# Altium schematic sheet PIC.SchDoc
size A4; SheetNumber: 1; SheetTotal: 1
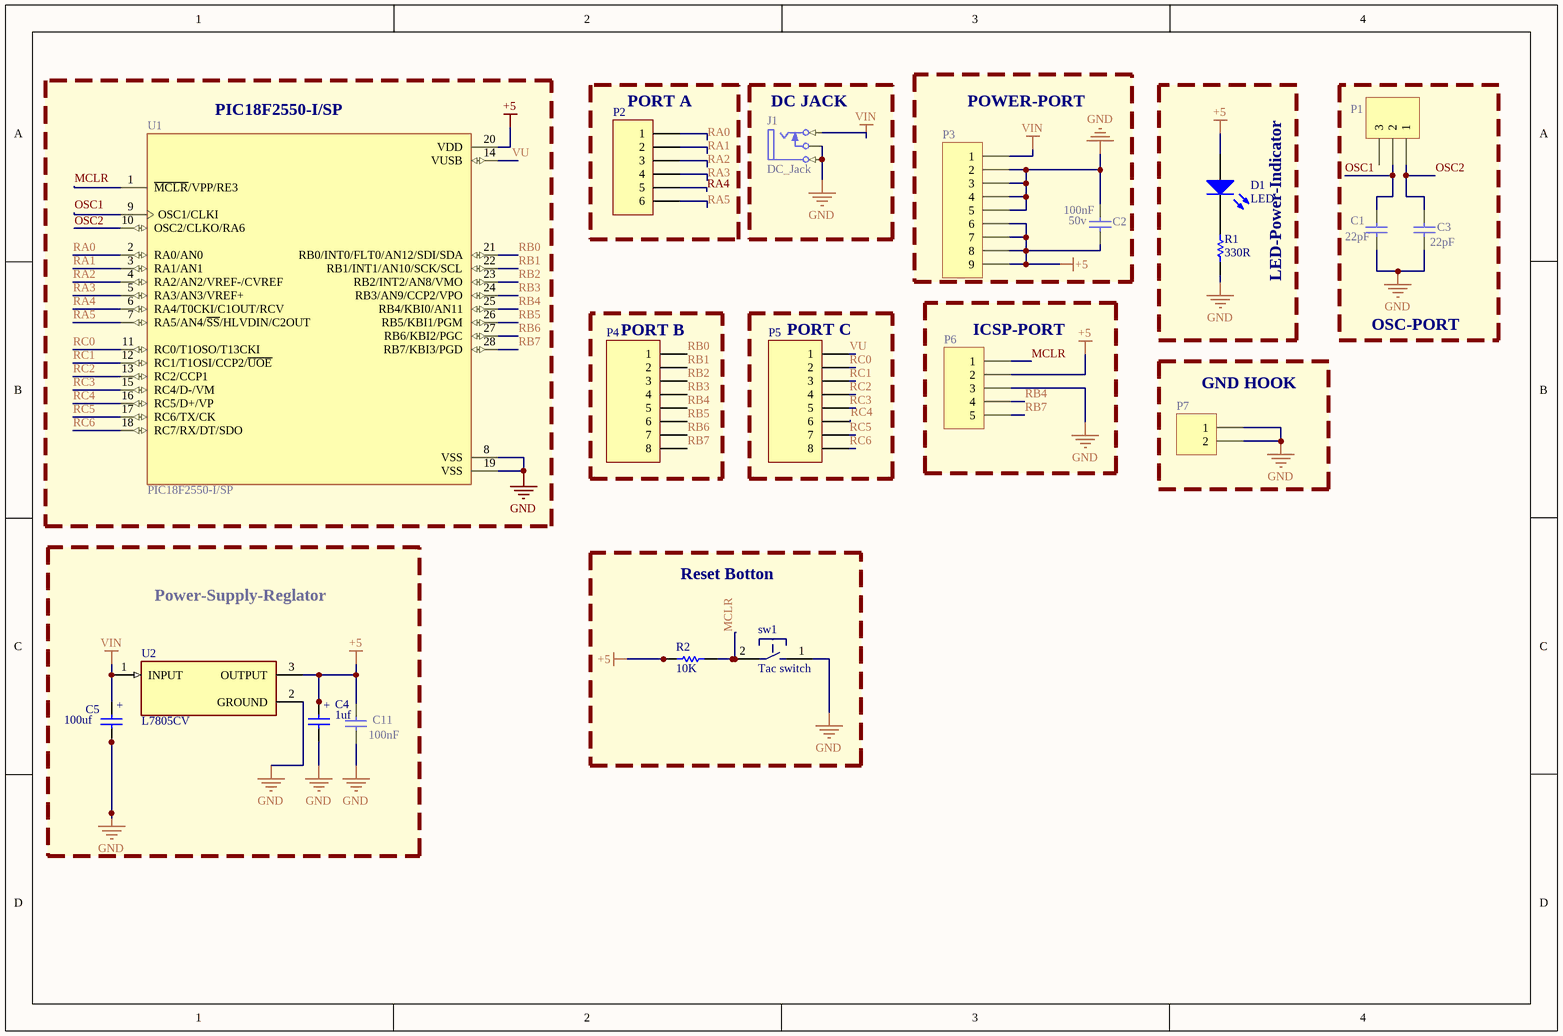
[diagram p0: PIC.SchDoc]

## Parts
C1  22pF  [My_cap100n]
C2  Volte: 50v  [My_cap100n]  (hidden comment: 100nF)
C3  22pF  [My_cap100n]
C4  1uf  [MY_E2.5-5mm]
C5  100uf  [MY_E2.5-5mm]
C11  100nF  [My_cap100n]
D1  LED  [My_LED3MM]
J1  DC_Jack  [My_DC_Jack]
P1  Header 3  [MY_FE03]  (value not drawn)
P2  Header 6  [MY_FE06]  (value not drawn)
P3  Header 9  [MY_FE09]  (value not drawn)
P4  Header 8  [MY_FE08]  (value not drawn)
P5  Header 8  [MY_FE08]  (value not drawn)
P6  Header 5  [MY_FE05]  (value not drawn)
P7  Header 2  [My_1X02]  (value not drawn)
R1  330R  [MY_(0.25w)_0207_10]
R2  10K  [MY_(0.25w)_0207_10]
sw1  Tac switch  [MY_TACTILE-PTH]
U1  PIC18F2550-I/SP  [DIP787W45P254L3556H508Q28]
U2  L7805CV  [TO255P1040X460X1968-3]

## Blocks framed on the sheet
PIC18F2550-I/SP: U1
PORT A: P2
DC JACK: J1
POWER-PORT: C2 P3
LED-Power-Indicator: D1 R1
OSC-PORT: C1 C3 P1
PORT B: P4
PORT C: P5
ICSP-PORT: P6
GND HOOK: P7
Power-Supply-Reglator: C4 C5 C11 U2
Reset Botton: R2 sw1

## Nets
+5: C2.1 C4.+ C11.2 D1.A P3.6 P3.7 P3.8 P3.9 P6.2 R2.1 U1.20(VDD) U2.3(OUTPUT)
GND: C1.1 C2.2 C3.1 C4.- C5.- C11.1 J1.2(TN) J1.3(S) P3.2 P3.3 P3.4 P3.5 P6.3 P7.1 P7.2 R1.1 sw1.1 U1.8(VSS) U1.19(VSS) U2.2(GROUND)
VIN: C5.+ J1.1(T) P3.1 U2.1(INPUT)
MCLR: P6.1 R2.2 sw1.2 U1.1(~{MCLR}/VPP/RE3)
OSC1: C1.2 P1.2 U1.9(OSC1/CLKI)
OSC2: C3.2 P1.1 U1.10(OSC2/CLKO/RA6)
RA0: P2.1 U1.2(RA0/AN0)
RA1: P2.2 U1.3(RA1/AN1)
RA2: P2.3 U1.4(RA2/AN2/VREF-/CVREF)
RA3: P2.4 U1.5(RA3/AN3/VREF+)
RA4: P2.5 U1.6(RA4/T0CKI/C1OUT/RCV)
RA5: P2.6 U1.7(RA5/AN4/~{SS}/HLVDIN/C2OUT)
RB0: P4.1 U1.21(RB0/INT0/FLT0/AN12/SDI/SDA)
RB1: P4.2 U1.22(RB1/INT1/AN10/SCK/SCL)
RB2: P4.3 U1.23(RB2/INT2/AN8/VMO)
RB3: P4.4 U1.24(RB3/AN9/CCP2/VPO)
RB4: P4.5 P6.4 U1.25(RB4/KBI0/AN11)
RB5: P4.6 U1.26(RB5/KBI1/PGM)
RB6: P4.7 U1.27(RB6/KBI2/PGC)
RB7: P4.8 P6.5 U1.28(RB7/KBI3/PGD)
RC0: P5.2 U1.11(RC0/T1OSO/T13CKI)
RC1: P5.3 U1.12(RC1/T1OSI/CCP2/~{UOE})
RC2: P5.4 U1.13(RC2/CCP1)
RC3: P5.5 U1.15(RC4/D-/VM)
RC4: P5.6 U1.16(RC5/D+/VP)
RC5: P5.7 U1.17(RC6/TX/CK)
RC6: P5.8 U1.18(RC7/RX/DT/SDO)
VU: P5.1 U1.14(VUSB)
NetD1_K: D1.K R1.2

Not connected (* = marked no-connect by the designer): P1 3

## Library data of the parts
C1 C3 C11 = Cap ceramic: None polar capacitor; ASiD Part Number: C-AS; Volte: 50v
  C1 C3: Value: 22pF
  C11: Value: 100nF
C2 = Cap ceramic: None polar capacitor; ASiD Part Number: C-AS; Value: 100nF
C4 C5 = Cap Pol: Polar capacitor; ASiD Part Number: C-AS; Volte: 25v
  C4: Value: 1uf
  C5: Value: 100uf
D1 = LED: Typical INFRARED GaAs LED; ASiD Part Number: LED-AS
J1 = DC_Jack: ASiD Part Number: DC_Jack-AS
P1 = Header 3: Header, 3-Pin; ASiD Part Number: Header 3-AS
P2 = Header 6: Header, 6-Pin; ASiD Part Number: Header 6-AS
P3 = Header 9: Header, 9-Pin; ASiD Part Number: Header 9-AS
P4 P5 = Header 8: Header, 8-Pin, Dual row; ASiD Part Number: Header 8-AS
P6 = Header 5: Header, 5-Pin; ASiD Part Number: Header 5-AS
P7 = Header 2: Header, 2-Pin; ASiD Part Number: Header 2-AS
R1 R2 = Res: Standard resistor 1K; ASiD Part Number: Res-AS
  R1: Value: 330R
  R2: Value: 10K
sw1 = Tac switch: small tac switch; ASiD Part Number: Tac switch-AS
U1 = PIC18F2550-I/SP: PIC PICÂ® 18F Microcontroller IC 8-Bit 48MHz 32KB (16K x 16) FLASH 28-SPDIP; MF: Microchip; Digi-Key_Part_Number: PIC18F2550-I/SP-ND; SnapEDA_Link: https://www.snapeda.com/parts/PIC18F2550-I/SP/Microchip/view-part/?ref=snap; Check_prices: https://www.snapeda.com/parts/PIC18F2550-I/SP/Microchip/view-part/?ref=eda; MP: PIC18F2550-I/SP; Package: SPDIP-28 Microchip; Purchase-URL: https://pricing.snapeda.com/search/part/PIC18F2550-I/SP/?ref=eda; Value: *
U2 = L7805CV: Linear Voltage Regulator IC Positive Fixed 1 Output 1.5A TO-220; MF: STMicroelectronics; SnapEDA_Link: https://www.snapeda.com/parts/L7805CV/STMicroelectronics/view-part/?ref=snap; Package: TO-220-3 STMicroelectronics; Value: *; MP: L7805CV; Check_prices: https://www.snapeda.com/parts/L7805CV/STMicroelectronics/view-part/?ref=eda